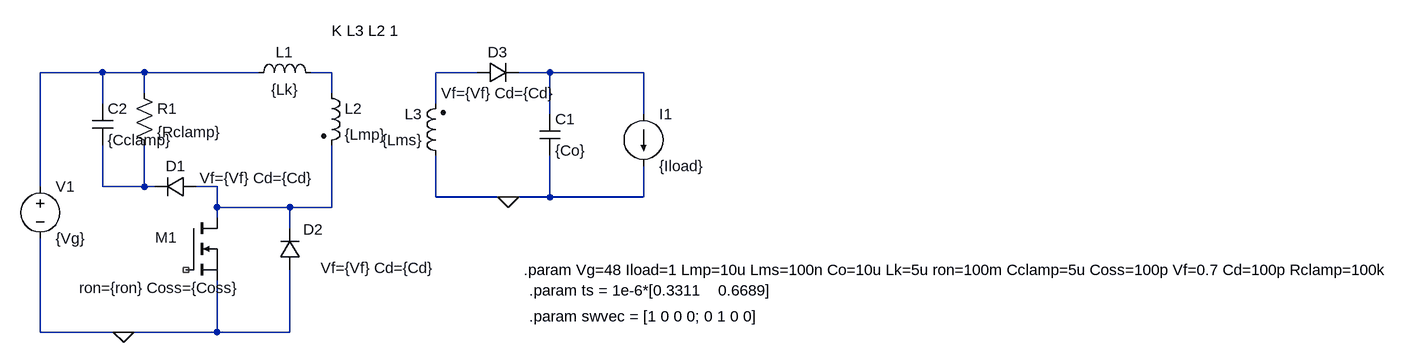
[diagram p0: schematic FlybackClamp.asc]
FlybackClamp.asc, the LTspice schematic file:
Version 4
SHEET 1 2076 680
WIRE -48 -48 -144 -48
WIRE 16 -48 -48 -48
WIRE 192 -48 16 -48
WIRE 304 -48 272 -48
WIRE 528 -48 464 -48
WIRE 640 -48 592 -48
WIRE 784 -48 640 -48
WIRE 16 -16 16 -48
WIRE 304 -16 304 -48
WIRE -48 0 -48 -48
WIRE 464 0 464 -48
WIRE 640 16 640 -48
WIRE 784 16 784 -48
WIRE -144 128 -144 -48
WIRE -48 128 -48 64
WIRE 16 128 16 64
WIRE 16 128 -48 128
WIRE 32 128 16 128
WIRE 128 128 96 128
WIRE 464 144 464 80
WIRE 576 144 464 144
WIRE 640 144 640 80
WIRE 640 144 576 144
WIRE 784 144 784 96
WIRE 784 144 640 144
WIRE 128 160 128 128
WIRE 240 160 128 160
WIRE 304 160 304 64
WIRE 304 160 240 160
WIRE 128 176 128 160
WIRE 240 192 240 160
WIRE -144 352 -144 208
WIRE -16 352 -144 352
WIRE 128 352 128 272
WIRE 128 352 -16 352
WIRE 240 352 240 256
WIRE 240 352 128 352
FLAG -16 352 0
FLAG 576 144 0
SYMBOL nmos 80 176 R0
WINDOW 0 -47 30 Left 2
WINDOW 3 -164 108 Left 2
SYMATTR InstName M1
SYMATTR Value ron={ron} Coss={Coss}
SYMBOL ind 176 -32 R270
WINDOW 0 32 56 VTop 2
WINDOW 3 5 56 VBottom 2
SYMATTR InstName L1
SYMATTR Value {Lk}
SYMBOL ind2 288 -32 R0
SYMATTR InstName L2
SYMATTR Value {Lmp}
SYMATTR Type ind
SYMBOL ind2 480 96 R180
WINDOW 0 36 80 Left 2
WINDOW 3 36 40 Left 2
SYMATTR InstName L3
SYMATTR Value {Lms}
SYMATTR Type ind
SYMBOL diode 528 -32 R270
WINDOW 0 32 32 VTop 2
WINDOW 3 0 32 VBottom 2
SYMATTR InstName D3
SYMATTR Value Vf={Vf} Cd={Cd}
SYMBOL cap 624 16 R0
SYMATTR InstName C1
SYMATTR Value {Co}
SYMBOL current 784 16 R0
SYMATTR InstName I1
SYMATTR Value {Iload}
SYMBOL voltage -144 112 R0
SYMATTR InstName V1
SYMATTR Value {Vg}
SYMBOL cap -64 0 R0
SYMATTR InstName C2
SYMATTR Value {Cclamp}
SYMBOL res 0 -32 R0
SYMATTR InstName R1
SYMATTR Value {Rclamp}
SYMBOL diode 96 112 R90
WINDOW 0 0 32 VBottom 2
WINDOW 3 -13 -93 VTop 2
SYMATTR InstName D1
SYMATTR Value Vf={Vf} Cd={Cd}
SYMBOL diode 256 256 R180
WINDOW 0 -35 62 Left 2
WINDOW 3 -206 3 Left 2
SYMATTR InstName D2
SYMATTR Value Vf={Vf} Cd={Cd}
TEXT 600 256 Left 2 !.param Vg=48 Iload=1 Lmp=10u Lms=100n Co=10u Lk=5u ron=100m Cclamp=5u Coss=100p Vf=0.7 Cd=100p Rclamp=100k
TEXT 608 288 Left 2 !.param ts = 1e-6*[0.3311    0.6689]
TEXT 608 328 Left 2 !.param swvec = [1 0 0 0; 0 1 0 0]
TEXT 304 -112 Left 2 !K L3 L2 1

The netlist it stands for:
* FlybackClamp.asc
M1 N006 NC_01 0 0 ron={ron} Coss={Coss}
L1 N001 N002 {Lk}
L2 N002 N006 {Lmp}
L3 0 N003 {Lms}
D3 N003 N004 Vf={Vf} Cd={Cd}
C1 N004 0 {Co}
I1 N004 0 {Iload}
V1 N001 0 {Vg}
C2 N001 N005 {Cclamp}
R1 N001 N005 {Rclamp}
D1 N006 N005 Vf={Vf} Cd={Cd}
D2 0 N006 Vf={Vf} Cd={Cd}
.model D D
.lib standard.dio
.model NMOS NMOS
.model PMOS PMOS
.lib standard.mos
.param Vg=48 Iload=1 Lmp=10u Lms=100n Co=10u Lk=5u ron=100m Cclamp=5u Coss=100p Vf=0.7 Cd=100p Rclamp=100k
.param ts = 1e-6*[0.3311    0.6689]
.param swvec = [1 0 0 0; 0 1 0 0]
K L3 L2 1
.backanno
.end